# Altium project PCB_ESCv1.PrjPcb
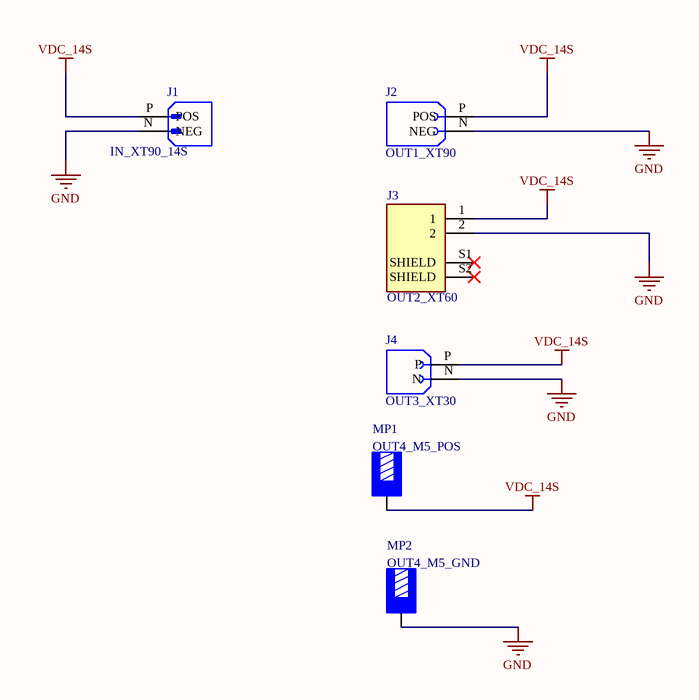
[diagram p0: Sheet1.SchDoc]
1 sheet, 6 parts. Net scope: global (net labels, ports and power ports of the same name join across sheets).
Board file: PCB1.PcbDoc

## Sheet Sheet1.SchDoc
size A4; SheetNumber: 1; SheetTotal: 1

### Parts
J1  IN_XT90_14S  [AMASS_XT90PW-M]
J2  OUT1_XT90  [AMASS_XT90PW-F]
J3  OUT2_XT60  [AMASS_XT60PW-F]
J4  OUT3_XT30  [AMASS_XT30PW-F]
MP1  OUT4_M5_POS  [74650195]
MP2  OUT4_M5_GND  [74650195]

### Nets
GND: J1.N(NEG) J2.N(NEG) J3.2 J4.N MP2.1
VDC_14S: J1.P(POS) J2.P(POS) J3.1 J4.P MP1.1

Not connected (* = marked no-connect by the designer): J3 S1(SHIELD)* S2(SHIELD)*

### Library data of the parts
J1 = XT90PW-M: XT90 horizontal male
J2 = XT90F-PW
J3 = XT60PW-F: Socket DC Supply Connector Female; MF: AMASS; SnapEDA_Link: https://www.snapeda.com/parts/XT60PW-F/AMASS/view-part/?ref=snap; Package: Package; Availability: Not in stock; Price: None; Check_prices: https://www.snapeda.com/parts/XT60PW-F/AMASS/view-part/?ref=eda; MP: XT60PW-F; Value: *
J4 = XT30PW-F: Socket; DC supply; XT30; female; PIN: 2; on PCBs; THT; yellow; 15A; MF: amass; SnapEDA_Link: https://www.snapeda.com/parts/XT30PW-F/AMASS/view-part/?ref=snap; Package: None; Value: *; MP: XT30PW-F; Check_prices: https://www.snapeda.com/parts/XT30PW-F/AMASS/view-part/?ref=eda
MP1 MP2 = CMP-03913-78872234-2: Bush, Thr, Internal Blind-hole Thread, 10 Mm W X 7 Mm H, M5, 9 Pins / 74650195R; Current Rating: 85A; Number of Pins: 9; Width: 10mm; RoHS: Compliant; Material: Brass; Height: 4mm; REACH SVHC: No; Max Operating Temperature: 150°C; Min Operating Temperature: -55°C; Packaging: Tape and Reel